# Altium schematic sheet Top-Sheet.SchDoc
size A4; SheetNumber: 1; SheetTotal: 5
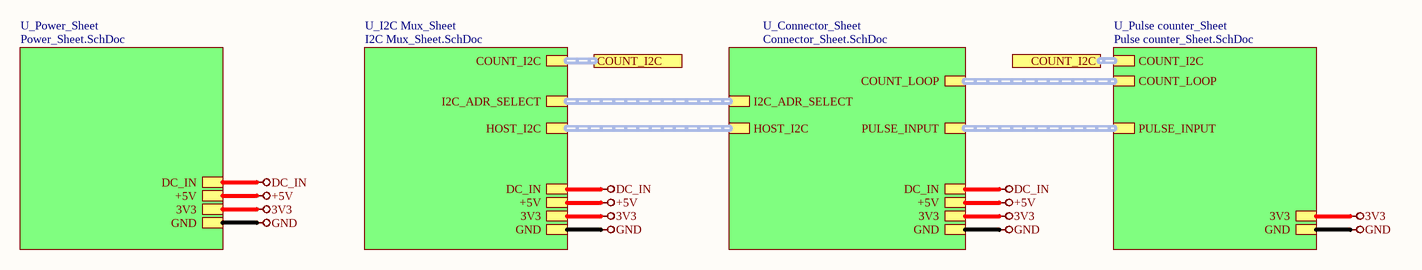
[diagram p0: Top-Sheet.SchDoc]

## Sub-sheets
U_Connector_Sheet = Connector_Sheet.SchDoc: PULSE_INPUT (harness PULSE_INPUT), COUNT_LOOP (harness COUNT_LOOP), I2C_ADR_SELECT (harness I2C_ADR_SELECT), HOST_I2C (harness HOST_I2C), DC_IN, 3V3, GND, +5V
U_I2C Mux_Sheet = I2C Mux_Sheet.SchDoc: COUNT_I2C (harness COUNT_I2C), I2C_ADR_SELECT (harness I2C_ADR_SELECT), HOST_I2C (harness HOST_I2C), DC_IN, 3V3, GND, +5V
U_Power_Sheet = Power_Sheet.SchDoc: DC_IN, +5V, 3V3, GND
U_Pulse counter_Sheet = Pulse counter_Sheet.SchDoc: COUNT_I2C (harness COUNT_I2C), COUNT_LOOP (harness COUNT_LOOP), PULSE_INPUT (harness PULSE_INPUT), 3V3, GND

## Ports
COUNT_I2C

## Nets
3V3: sheet U_Power_Sheet/3V3, sheet U_I2C Mux_Sheet/3V3, sheet U_Connector_Sheet/3V3, sheet U_Pulse counter_Sheet/3V3
+5V: sheet U_Power_Sheet/+5V, sheet U_I2C Mux_Sheet/+5V, sheet U_Connector_Sheet/+5V
DC_IN: sheet U_Power_Sheet/DC_IN, sheet U_I2C Mux_Sheet/DC_IN, sheet U_Connector_Sheet/DC_IN
GND: sheet U_Power_Sheet/GND, sheet U_I2C Mux_Sheet/GND, sheet U_Connector_Sheet/GND, sheet U_Pulse counter_Sheet/GND

## Buses and harness runs
harness port COUNT_I2C = sheet U_I2C Mux_Sheet/COUNT_I2C
harness port COUNT_I2C = sheet U_Pulse counter_Sheet/COUNT_I2C
harness sheet U_Connector_Sheet/COUNT_LOOP = sheet U_Pulse counter_Sheet/COUNT_LOOP
harness sheet U_Connector_Sheet/HOST_I2C = sheet U_I2C Mux_Sheet/HOST_I2C
harness sheet U_Connector_Sheet/I2C_ADR_SELECT = sheet U_I2C Mux_Sheet/I2C_ADR_SELECT
harness sheet U_Connector_Sheet/PULSE_INPUT = sheet U_Pulse counter_Sheet/PULSE_INPUT

## Notes on the sheet
- File:
- Title:
- Date:
- Page
- Num:
- Total:
- Drawn By: Huzaifa Ali